# Altium schematic sheet 02_KOM_ACB23_4009_Overview_PCB.SchDoc: Overview PCB
size A4; DocumentNumber: 2023-03-28; Revision: v0.11; SheetNumber: 2; SheetTotal: 9
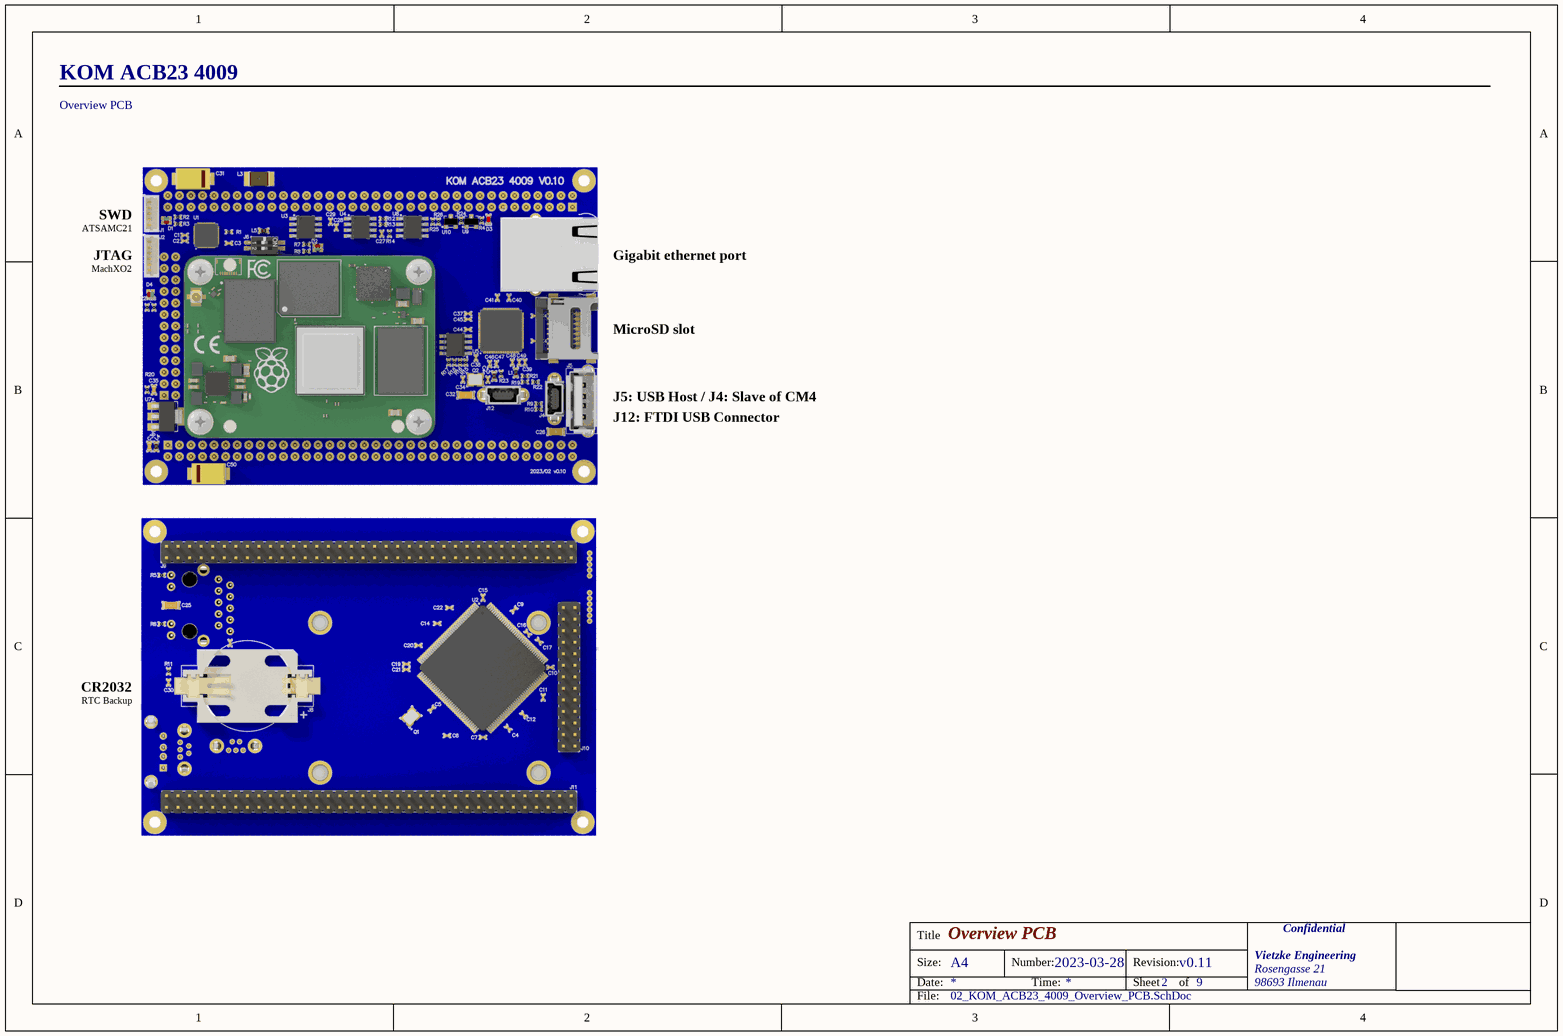
[diagram p0: 02_KOM_ACB23_4009_Overview_PCB.SchDoc]

## Notes on the sheet
- KOM ACB23 4009
- Overview PCB
- SWD
- JTAG
- ATSAMC21
- Gigabit ethernet port
- MachXO2
- MicroSD slot
- J5: USB Host / J4: Slave of CM4
- J12: FTDI USB Connector
- CR2032
- RTC Backup
- Title
- Size:
- Date:
- A4
- Number:
- Time:
- Revision:
- Sheet
- of
- Vietzke Engineering
- Rosengasse 21
- 98693 Ilmenau
- Confidential
- File: